# Altium schematic sheet Hdr4.SchDoc
size Letter; SheetNumber: 12; SheetTotal: 15
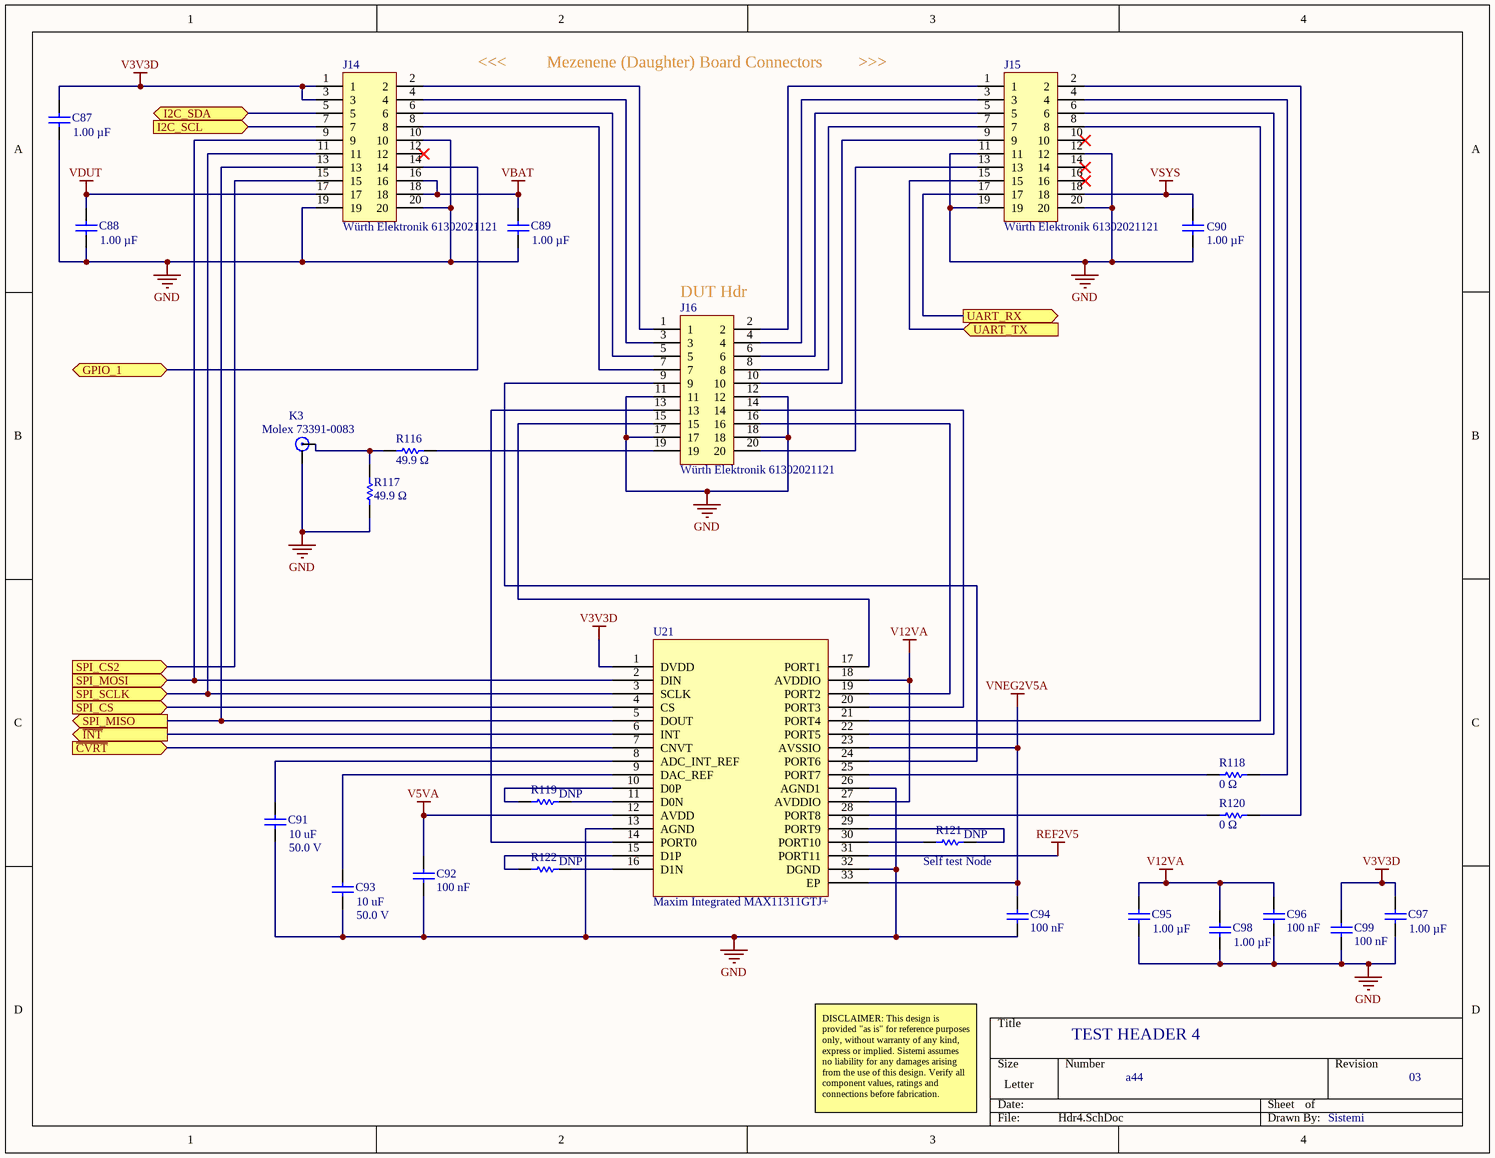
[diagram p0: Hdr4.SchDoc]

## Parts
C87  Capacitance: 1.00 µF  [CAPC1608X90X35NL15T15]  (hidden comment: Samsung CL10B105KA8NNNC)
C88  Capacitance: 1.00 µF  [CAPC1608X90X35NL15T15]  (hidden comment: Samsung CL10B105KA8NNNC)
C89  Capacitance: 1.00 µF  [CAPC1608X90X35NL15T15]  (hidden comment: Samsung CL10B105KA8NNNC)
C90  Capacitance: 1.00 µF  [CAPC1608X90X35NL15T15]  (hidden comment: Samsung CL10B105KA8NNNC)
C91  Capacitance: 10 uF  Voltage Rating (DC): 50.0 V  [CAPC3216X180X55LL20T25]  (hidden comment: Murata GRM31CR61H106KA12L)
C92  Capacitance: 100 nF  [CAPC1005X56X25NL10T15]  (hidden comment: Samsung CL05B104KO5NNNC)
C93  Capacitance: 10 uF  Voltage Rating (DC): 50.0 V  [CAPC3216X180X55LL20T25]  (hidden comment: Murata GRM31CR61H106KA12L)
C94  Capacitance: 100 nF  [CAPC1005X56X25NL10T15]  (hidden comment: Samsung CL05B104KO5NNNC)
C95  Capacitance: 1.00 µF  [CAPC1608X90X35NL15T15]  (hidden comment: Samsung CL10B105KA8NNNC)
C96  Capacitance: 100 nF  [CAPC1005X56X25NL10T15]  (hidden comment: Samsung CL05B104KO5NNNC)
C97  Capacitance: 1.00 µF  [CAPC1608X90X35NL15T15]  (hidden comment: Samsung CL10B105KA8NNNC)
C98  Capacitance: 1.00 µF  [CAPC1608X90X35NL15T15]  (hidden comment: Samsung CL10B105KA8NNNC)
C99  Capacitance: 100 nF  [CAPC1005X56X25NL10T15]  (hidden comment: Samsung CL05B104KO5NNNC)
J14  Würth Elektronik 61302021121  [PCB-nk6cd1c3p7lqby8wsdwb-1]
J15  Würth Elektronik 61302021121  [PCB-nk6cd1c3p7lqby8wsdwb-1]
J16  Würth Elektronik 61302021121  [PCB-nk6cd1c3p7lqby8wsdwb-1]
K3  Molex 73391-0083  [PCB-bfde39zrvmm7lhgxtykn-1]
R116  Resistance: 49.9 Ω  [RESC1608X55X30ML15T15]  (hidden comment: Generic RES 0603)
R117  Resistance: 49.9 Ω  [RESC1608X55X30ML15T15]  (hidden comment: Generic RES 0603)
R118  Resistance: 0 Ω  [RESC1608X55X30ML15T15]  (hidden comment: Generic RES 0603)
R119  Resistance: DNP  [RESC1608X55X30ML15T15]  (hidden comment: Generic RES 0603)
R120  Resistance: 0 Ω  [RESC1608X55X30ML15T15]  (hidden comment: Generic RES 0603)
R121  Resistance: DNP  [RESC1608X55X30ML15T15]  (hidden comment: Generic RES 0603)
R122  Resistance: DNP  [RESC1608X55X30ML15T15]  (hidden comment: Generic RES 0603)
U21  Maxim Integrated MAX11311GTJ+  [PCB-s1hzzxkmij8s4b201del-1]

## Ports
GPIO_1 (bidir), I2C_SCL (in), I2C_SDA (bidir), SPI_CS2 (in), SPI_CS (in), SPI_MISO (out), SPI_MOSI (in), SPI_SCLK (in), UART_RX (out), UART_TX (in), ~{CVRT} (in), ~{INT} (out)

## Nets
GND: C87.1 C88.1 C89.1 C90.1 C91.1 C92.2 C93.1 C94.2 C95.1 C96.2 C97.1 C98.1 C99.2 J14.10 J14.19 J14.20 J15.11 J15.12 J15.19 J15.20 J16.11 J16.12 J16.17 J16.18 K3.2 R117.2 U21.13(AGND) U21.26(AGND1) U21.32(DGND)
REF2V5: U21.31(PORT11)
V3V3D: C87.2 C97.2 C99.1 J14.1 J14.3 U21.1(DVDD)
V5VA: C92.1 U21.12(AVDD)
V12VA: C95.2 C96.1 C98.2 U21.18(AVDDIO) U21.27(AVDDIO)
VBAT: C89.2 J14.16 J14.18
VDUT: C88.2 J14.17
VNEG2V5A: C94.1 U21.23(AVSSIO) U21.33(EP)
VSYS: C90.2 J15.18
~{CVRT}: U21.7(CNVT) ; port ~{CVRT}
GPIO_1: J14.14 ; port GPIO_1
I2C_SCL: J14.7 ; port I2C_SCL
I2C_SDA: J14.5 ; port I2C_SDA
~{INT}: U21.6(INT) ; port ~{INT}
SPI_CS: U21.4(CS) ; port SPI_CS
SPI_CS2: J14.15 ; port SPI_CS2
SPI_MISO: J14.13 U21.5(DOUT) ; port SPI_MISO
SPI_MOSI: J14.9 U21.2(DIN) ; port SPI_MOSI
SPI_SCLK: J14.11 U21.3(SCLK) ; port SPI_SCLK
UART_RX: J15.17 ; port UART_RX
UART_TX: J15.15 ; port UART_TX
NetC91_2: C91.2 U21.8(ADC_INT_REF)
NetC93_2: C93.2 U21.9(DAC_REF)
NetJ14_2: J14.2 J16.1
NetJ14_4: J14.4 J16.3
NetJ14_6: J14.6 J16.5
NetJ14_8: J14.8 J16.7
NetJ15_1: J15.1 J16.2
NetJ15_2: J15.2 R120.1
NetJ15_3: J15.3 J16.4
NetJ15_4: J15.4 R118.1
NetJ15_5: J15.5 J16.6
NetJ15_6: J15.6 U21.22(PORT5)
NetJ15_7: J15.7 J16.8
NetJ15_8: J15.8 U21.21(PORT4)
NetJ15_9: J15.9 J16.10
NetJ15_13: J15.13 J16.20
NetJ16_9: J16.9 U21.24(PORT6)
NetJ16_13: J16.13 U21.14(PORT0)
NetJ16_14: J16.14 U21.20(PORT3)
NetJ16_15: J16.15 U21.17(PORT1)
NetJ16_16: J16.16 U21.19(PORT2)
NetJ16_19: J16.19 R116.2
NetK3_1: K3.1 R116.1 R117.1
NetR118_2: R118.2 U21.25(PORT7)
NetR119_1: R119.1 U21.11(D0N)
NetR119_2: R119.2 U21.10(D0P)
NetR120_2: R120.2 U21.28(PORT8)
NetR121_1: R121.1 U21.29(PORT9)
NetR121_2: R121.2 U21.30(PORT10)
NetR122_1: R122.1 U21.16(D1N)
NetR122_2: R122.2 U21.15(D1P)

Not connected (* = marked no-connect by the designer): J14 12*; J15 10* 14* 16*

## Notes on the sheet
- (near J15) <<<         Mezenene (Daughter) Board Connectors        >>>
- (near J16) DUT Hdr
- (near R121) Self test Node
- TEST HEADER 4
- DISCLAIMER: This design is provided "as is" for reference purposes only, without warranty of any kind, express or implied. Sistemi assumes no liability for any damages arising from the use of this design. Verify all component values, ratings and connections before fabrication.
- a44
- 03
- Sistemi

## Library data of the parts
C87-C90 C95 C97 C98 = CMP-7473528-5: CL Series 0603 1 uF 25 V ±10 % X7R Surface Mount Multilayer Ceramic Capacitor; Manufacturer Part Number: UMK107AB7105KA-T; Lead-Free Status: Lead Free; Capacitance Tolerance: ±10%; Voltage Rating (DC): 25.0 V; RoHS: Compliant; Mounting Style: Surface Mount; Footprint: PCB-0002-00062-3; Octopart URL: http://octopart.com/cl10b105ka8nnnc-samsung-19831597; Case/Package: 0603; OctopartID: ce7a065e703111bd; Dielectric Characteristic: X7R
C91 C93 = CMP-3554908-2: Multilayer Ceramic Capacitors MLCC - SMD/SMT 1206 10uF 50volt X5R +/-10%; Manufacturer Part Number: CL31B106KBHNNNE; Capacitance Tolerance: ±10%; Case/Package (SI): 3216; Lead-Free Status: Lead Free; Dielectric Characteristic: X5R; Lifecycle Status: Active; Mounting Style: Surface Mount; Number of Pins: 2; Octopart Url: https://octopart.com/grm31cr61h106ka12l-murata-18903335; OctopartID: fd8535afa9c42242; Packaging: Cut Tape (CT); REACH SVHC Compliance: No SVHC; RoHS: Compliant; Size-Length: 0.0032 m; Size-Thickness: 0.0016 m; Size-Width: 0.0016 m
C92 C94 C96 C99 = CMP-bf2276a55d9a60e5-19: Ceramic capacitor SMD-0402 100nF /16V X7R# K +-10%, Samsung, RoHS; Dielectric Characteristic: X7R; Lead-Free Status: Lead Free; Voltage Rating (DC): 16.0 V; Capacitance Tolerance: ±10%; Mounting Style: Surface Mount; Case/Package: 0402; OctopartID: 0755ced2c795d892; Footprint: PCB-0002-00476-3; Octopart URL: https://octopart.com/cl05b104ko5nnnc-samsung-9299366; RoHS: Compliant; Manufacturer Part Number: CL05B104KO5NNNC
J14-J16 = CMP-005cc8a3733edf9b-7: THT Vertical Pin Header WR-PHD, Pitch 2.54 mm, Dual Row, 20 pins; Current Rating: 3.00 A; Dielectric Withstanding Voltage: 500 V; Pin Pitch: 2.54 mm; Operating Voltage: 250 V; Number of Contacts: 20; Contact Resistance: 20.0 mΩ; Gender: Male; Contact Material: Copper; Footprint: PCB-005cc8a3733edf9b-1; Mounting Style: Through Hole; Color: Black; Contact Plating: Gold; REACH SVHC Compliance: No SVHC; RoHS: Compliant; Octopart URL: https://octopart.com/61302021121-w%C3%BCrth+elektronik-32855556; Packaging: Bag; Orientation: Vertical; OctopartID: 005cc8a3733edf9b; Number of Pins: 20; Operating Temperature: -40.0 °C (min); Manufacturer Part Number: 61302021121
K3 = CMP-0644cd817e78d983-1: RF Connectors / Coaxial Connectors SMA ST JCK-REC 4HF CUP; Gender: Female; Contact Plating: Gold; Octopart URL: https://octopart.com/73391-0083-molex-47144282; Orientation: Right Angle; OctopartID: 0644cd817e78d983; RoHS: Compliant; Contact Material: Beryllium Copper; Manufacturer Part Number: 73391-0083; Mounting Style: Solder, PCB; Lifecycle Status: Not Listed by Manufacturer
R116 R117 = CMP-0800c38b3cf2d7c7-3: Generic RES 0603, =Resistance+','+Tolerance+','+Case; Manufacturer Part Number: AC1206FR-0749R9L; Case/Package (SI): 1608; Lead-Free Status: Lead Free; Power Rating: 63.0 mW; Voltage: 50V; ELV Compliant: Compliant; Tolerance: ±1%; Temperature Coefficient: -50.0 ppm/°C to 50.0 ppm/°C; Octopart URL: TBD; Number of Pins: 2; Mounting Style: Surface Mount; Packaging: Tape & Reel (TR); Lifecycle Status: Active; RoHS: Compliant; Case: 0603; Operating Temperature: -55.0 °C to 125 °C; REACH SVHC Compliance: No SVHC; Footprint: PCB-0002-00066-3; OctopartID: a8e96364fc37772e
R118 R120 = CMP-0800c38b3cf2d7c7-3: Generic RES 0603, =Resistance+','+Tolerance+','+Case; Manufacturer Part Number: CRCW06030000Z0EAC; Case/Package (SI): 1608; Lead-Free Status: Lead Free; Power Rating: 63.0 mW; Voltage: 50V; ELV Compliant: Compliant; Tolerance: ±1%; Temperature Coefficient: -50.0 ppm/°C to 50.0 ppm/°C; Octopart URL: TBD; Number of Pins: 2; Mounting Style: Surface Mount; Packaging: Tape & Reel (TR); Lifecycle Status: Active; RoHS: Compliant; Case: 0603; Operating Temperature: -55.0 °C to 125 °C; REACH SVHC Compliance: No SVHC; Footprint: PCB-0002-00066-3; OctopartID: a8e96364fc37772e
R119 R121 R122 = CMP-0800c38b3cf2d7c7-3: Generic RES 0603, =Resistance+','+Tolerance+','+Case; Manufacturer Part Number: TBD; Case/Package (SI): 1608; Lead-Free Status: Lead Free; Power Rating: 63.0 mW; Voltage: 50V; ELV Compliant: Compliant; Tolerance: ±1%; Temperature Coefficient: -50.0 ppm/°C to 50.0 ppm/°C; Octopart URL: TBD; Number of Pins: 2; Mounting Style: Surface Mount; Packaging: Tape & Reel (TR); Lifecycle Status: Active; RoHS: Compliant; Case: 0603; Operating Temperature: -55.0 °C to 125 °C; REACH SVHC Compliance: No SVHC; Footprint: PCB-0002-00066-3; OctopartID: a8e96364fc37772e
U21 = CMP-2cd8e1e00624f31f-4: 12-channel 12-Bit ADC and 12-Bit DAC, Analog PIXI, 12-Port Programmable Mixed-Signal I/O; Channels: 12; Lead-Free Status: Lead Free; Sample Rate: 400 kHz; Range Options: 0 to 2.5V, ±5V, 0 to +10V, -10V; Supply Voltage (DC): 4.75 V (max), 5.25 V (min); Manufacturer Part Number: MAX11311GTJ+; Lifecycle Status: Not Listed by Manufacturer; Octopart URL: http://octopart.com/max11311gtj%2B-maxim+integrated-70389658; RoHS: Compliant; Number of Bits: 12; OctopartID: 2cd8e1e00624f31f; Package: TQFN-32; Resolution: 12-bit